# Altium project ATLAS(RZG2L).PrjPcb
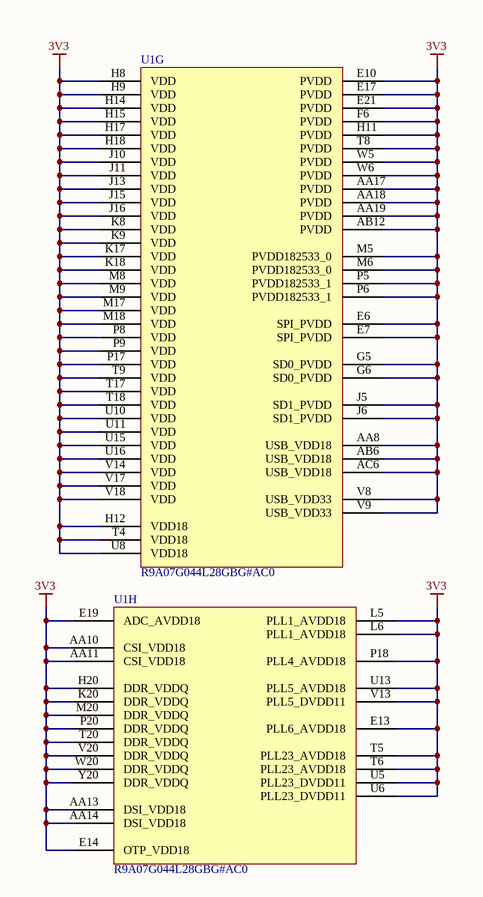
[diagram p0: MPU - PWR.SchDoc]
5 sheets, 21 parts. Net scope: global (net labels, ports and power ports of the same name join across sheets).
Board file: ATLAS(RZG2L).PcbDoc
Sheets:
  MPU - PWR.SchDoc
  MPU - GND.SchDoc
  MPU - DDR.SchDoc
  MPU - IO.SchDoc
  PMIC.SchDoc

## Sheet MPU - PWR.SchDoc
size A4; SheetNumber: 1; SheetTotal: 3

### Parts
U1  R9A07G044L28GBG#AC0  [R9A07G044L28GBG#AC0]  (parts G,H of 11)

### Nets
3V3: U1.AA8(USB_VDD18) U1.AA10(CSI_VDD18) U1.AA11(CSI_VDD18) U1.AA13(DSI_VDD18) U1.AA14(DSI_VDD18) U1.AA17(PVDD) U1.AA18(PVDD) U1.AA19(PVDD) U1.AB6(USB_VDD18) U1.AB12(PVDD) U1.AC6(USB_VDD18) U1.E6(SPI_PVDD) U1.E7(SPI_PVDD) U1.E10(PVDD) U1.E13(PLL6_AVDD18) U1.E14(OTP_VDD18) U1.E17(PVDD) U1.E19(ADC_AVDD18) U1.E21(PVDD) U1.F6(PVDD) U1.G5(SD0_PVDD) U1.G6(SD0_PVDD) U1.H8(VDD) U1.H9(VDD) U1.H11(PVDD) U1.H12(VDD18) U1.H14(VDD) U1.H15(VDD) U1.H17(VDD) U1.H18(VDD) U1.H20(DDR_VDDQ) U1.J5(SD1_PVDD) U1.J6(SD1_PVDD) U1.J10(VDD) U1.J11(VDD) U1.J13(VDD) U1.J15(VDD) U1.J16(VDD) U1.K8(VDD) U1.K9(VDD) U1.K17(VDD) U1.K18(VDD) U1.K20(DDR_VDDQ) U1.L5(PLL1_AVDD18) U1.L6(PLL1_AVDD18) U1.M5(PVDD182533_0) U1.M6(PVDD182533_0) U1.M8(VDD) U1.M9(VDD) U1.M17(VDD) U1.M18(VDD) U1.M20(DDR_VDDQ) U1.P5(PVDD182533_1) U1.P6(PVDD182533_1) U1.P8(VDD) U1.P9(VDD) U1.P17(VDD) U1.P18(PLL4_AVDD18) U1.P20(DDR_VDDQ) U1.T4(VDD18) U1.T5(PLL23_AVDD18) U1.T6(PLL23_AVDD18) U1.T8(PVDD) U1.T9(VDD) U1.T17(VDD) U1.T18(VDD) U1.T20(DDR_VDDQ) U1.U5(PLL23_DVDD11) U1.U6(PLL23_DVDD11) U1.U8(VDD18) U1.U10(VDD) U1.U11(VDD) U1.U13(PLL5_AVDD18) U1.U15(VDD) U1.U16(VDD) U1.V8(USB_VDD33) U1.V9(USB_VDD33) U1.V13(PLL5_DVDD11) U1.V14(VDD) U1.V17(VDD) U1.V18(VDD) U1.V20(DDR_VDDQ) U1.W5(PVDD) U1.W6(PVDD) U1.W20(DDR_VDDQ) U1.Y20(DDR_VDDQ)

### Library data of the parts
U1 = R9A07G044L28GBG#AC0: MPU RZ/G2L ARM Cortex-A55+/ARM Cortex-M33 RISC 64-Bit 1.2GHz 1.8V/3.3V 551-Pin BGA; Manufacturer Lifecycle Status: ACTIVE; Pitch: 800µm; Max Supply Voltage: 3.63V; Min Supply Voltage: 2.97V; RAM Size: 128kB; Number of USB Channels: 2; ComponentLink2Description: Datasheet URL; Mount: Surface Mount; ComponentLink2URL: https://octopart.com/cad-content/api/get-model-datasheet/15189/122020395; Height: 1.4mm; Export Control Classification Number (ECCN) Code: 3A991; Frequency: 1.2GHz; Max Frequency: 1.2GHz; ComponentLink1URL: http://www.renesas.com; Case/Package: BGA; Length: 21mm; Lifecycle Status: Production; ComponentLink3Description: Manufacturer's Package Drawing; Width: 21mm; China RoHS: Compliant; ComponentLink1Description: Manufacturer's Website; HelpURL: https://octopart.com/cad-content/api/get-model-datasheet/15189/122020395; RoHS: Compliant; Number of Pins: 551; ComponentLink3URL: https://www.renesas.com/en/document/psc/package-drawing-lfbga-551pin-plbg0551ga

## Sheet MPU - GND.SchDoc
size A4; SheetNumber: 2; SheetTotal: 4
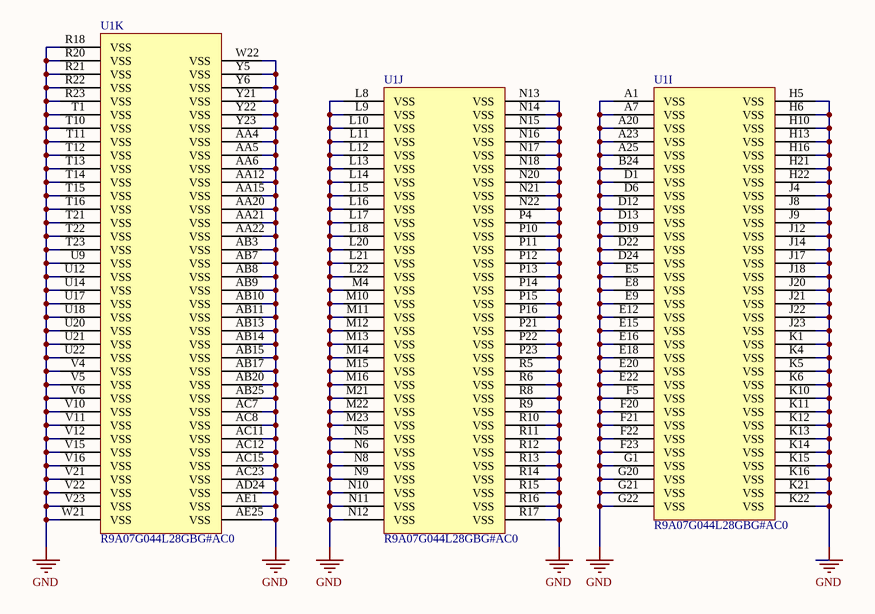
[diagram p1: MPU - GND.SchDoc]

### Parts
U1  R9A07G044L28GBG#AC0  [R9A07G044L28GBG#AC0]  (parts I,J,K of 11)

### Nets
GND: U1.A1(VSS) U1.A7(VSS) U1.A20(VSS) U1.A23(VSS) U1.A25(VSS) U1.AA4(VSS) U1.AA5(VSS) U1.AA6(VSS) U1.AA12(VSS) U1.AA15(VSS) U1.AA20(VSS) U1.AA21(VSS) U1.AA22(VSS) U1.AB3(VSS) U1.AB7(VSS) U1.AB8(VSS) U1.AB9(VSS) U1.AB10(VSS) U1.AB11(VSS) U1.AB13(VSS) U1.AB14(VSS) U1.AB15(VSS) U1.AB17(VSS) U1.AB20(VSS) U1.AB25(VSS) U1.AC7(VSS) U1.AC8(VSS) U1.AC11(VSS) U1.AC12(VSS) U1.AC15(VSS) U1.AC23(VSS) U1.AD24(VSS) U1.AE1(VSS) U1.AE25(VSS) U1.B24(VSS) U1.D1(VSS) U1.D6(VSS) U1.D12(VSS) U1.D13(VSS) U1.D19(VSS) U1.D22(VSS) U1.D24(VSS) U1.E5(VSS) U1.E8(VSS) U1.E9(VSS) U1.E12(VSS) U1.E15(VSS) U1.E16(VSS) U1.E18(VSS) U1.E20(VSS) U1.E22(VSS) U1.F5(VSS) U1.F20(VSS) U1.F21(VSS) U1.F22(VSS) U1.F23(VSS) U1.G1(VSS) U1.G20(VSS) U1.G21(VSS) U1.G22(VSS) U1.H5(VSS) U1.H6(VSS) U1.H10(VSS) U1.H13(VSS) U1.H16(VSS) U1.H21(VSS) U1.H22(VSS) U1.J4(VSS) U1.J8(VSS) U1.J9(VSS) U1.J12(VSS) U1.J14(VSS) U1.J17(VSS) U1.J18(VSS) U1.J20(VSS) U1.J21(VSS) U1.J22(VSS) U1.J23(VSS) U1.K1(VSS) U1.K4(VSS) U1.K5(VSS) U1.K6(VSS) U1.K10(VSS) U1.K11(VSS) U1.K12(VSS) U1.K13(VSS) U1.K14(VSS) U1.K15(VSS) U1.K16(VSS) U1.K21(VSS) U1.K22(VSS) U1.L8(VSS) U1.L9(VSS) U1.L10(VSS) U1.L11(VSS) U1.L12(VSS) U1.L13(VSS) U1.L14(VSS) U1.L15(VSS) U1.L16(VSS) U1.L17(VSS) U1.L18(VSS) U1.L20(VSS) U1.L21(VSS) U1.L22(VSS) U1.M4(VSS) U1.M10(VSS) U1.M11(VSS) U1.M12(VSS) U1.M13(VSS) U1.M14(VSS) U1.M15(VSS) U1.M16(VSS) U1.M21(VSS) U1.M22(VSS) U1.M23(VSS) U1.N5(VSS) U1.N6(VSS) U1.N8(VSS) U1.N9(VSS) U1.N10(VSS) U1.N11(VSS) U1.N12(VSS) U1.N13(VSS) U1.N14(VSS) U1.N15(VSS) U1.N16(VSS) U1.N17(VSS) U1.N18(VSS) U1.N20(VSS) U1.N21(VSS) U1.N22(VSS) U1.P4(VSS) U1.P10(VSS) U1.P11(VSS) U1.P12(VSS) U1.P13(VSS) U1.P14(VSS) U1.P15(VSS) U1.P16(VSS) U1.P21(VSS) U1.P22(VSS) U1.P23(VSS) U1.R5(VSS) U1.R6(VSS) U1.R8(VSS) U1.R9(VSS) U1.R10(VSS) U1.R11(VSS) U1.R12(VSS) U1.R13(VSS) U1.R14(VSS) U1.R15(VSS) U1.R16(VSS) U1.R17(VSS) U1.R18(VSS) U1.R20(VSS) U1.R21(VSS) U1.R22(VSS) U1.R23(VSS) U1.T1(VSS) U1.T10(VSS) U1.T11(VSS) U1.T12(VSS) U1.T13(VSS) U1.T14(VSS) U1.T15(VSS) U1.T16(VSS) U1.T21(VSS) U1.T22(VSS) U1.T23(VSS) U1.U9(VSS) U1.U12(VSS) U1.U14(VSS) U1.U17(VSS) U1.U18(VSS) U1.U20(VSS) U1.U21(VSS) U1.U22(VSS) U1.V4(VSS) U1.V5(VSS) U1.V6(VSS) U1.V10(VSS) U1.V11(VSS) U1.V12(VSS) U1.V15(VSS) U1.V16(VSS) U1.V21(VSS) U1.V22(VSS) U1.V23(VSS) U1.W21(VSS) U1.W22(VSS) U1.Y5(VSS) U1.Y6(VSS) U1.Y21(VSS) U1.Y22(VSS) U1.Y23(VSS)

### Library data of the parts
U1 = R9A07G044L28GBG#AC0: as U1 on sheet MPU - PWR; ComponentLink2Description: Datasheet URL; Mount: Surface Mount; ComponentLink2URL: https://octopart.com/cad-content/api/get-model-datasheet/15189/122020395; Height: 1.4mm; Export Control Classification Number (ECCN) Code: 3A991; Frequency: 1.2GHz; Max Frequency: 1.2GHz; ComponentLink1URL: http://www.renesas.com; Case/Package: BGA; Length: 21mm; Lifecycle Status: Production; ComponentLink3Description: Manufacturer's Package Drawing; Width: 21mm; China RoHS: Compliant; ComponentLink1Description: Manufacturer's Website; HelpURL: https://octopart.com/cad-content/api/get-model-datasheet/15189/122020395; RoHS: Compliant; Number of Pins: 551; ComponentLink3URL: https://www.renesas.com/en/document/psc/package-drawing-lfbga-551pin-plbg0551ga

## Sheet MPU - DDR.SchDoc
size A4; SheetNumber: 2; SheetTotal: 3
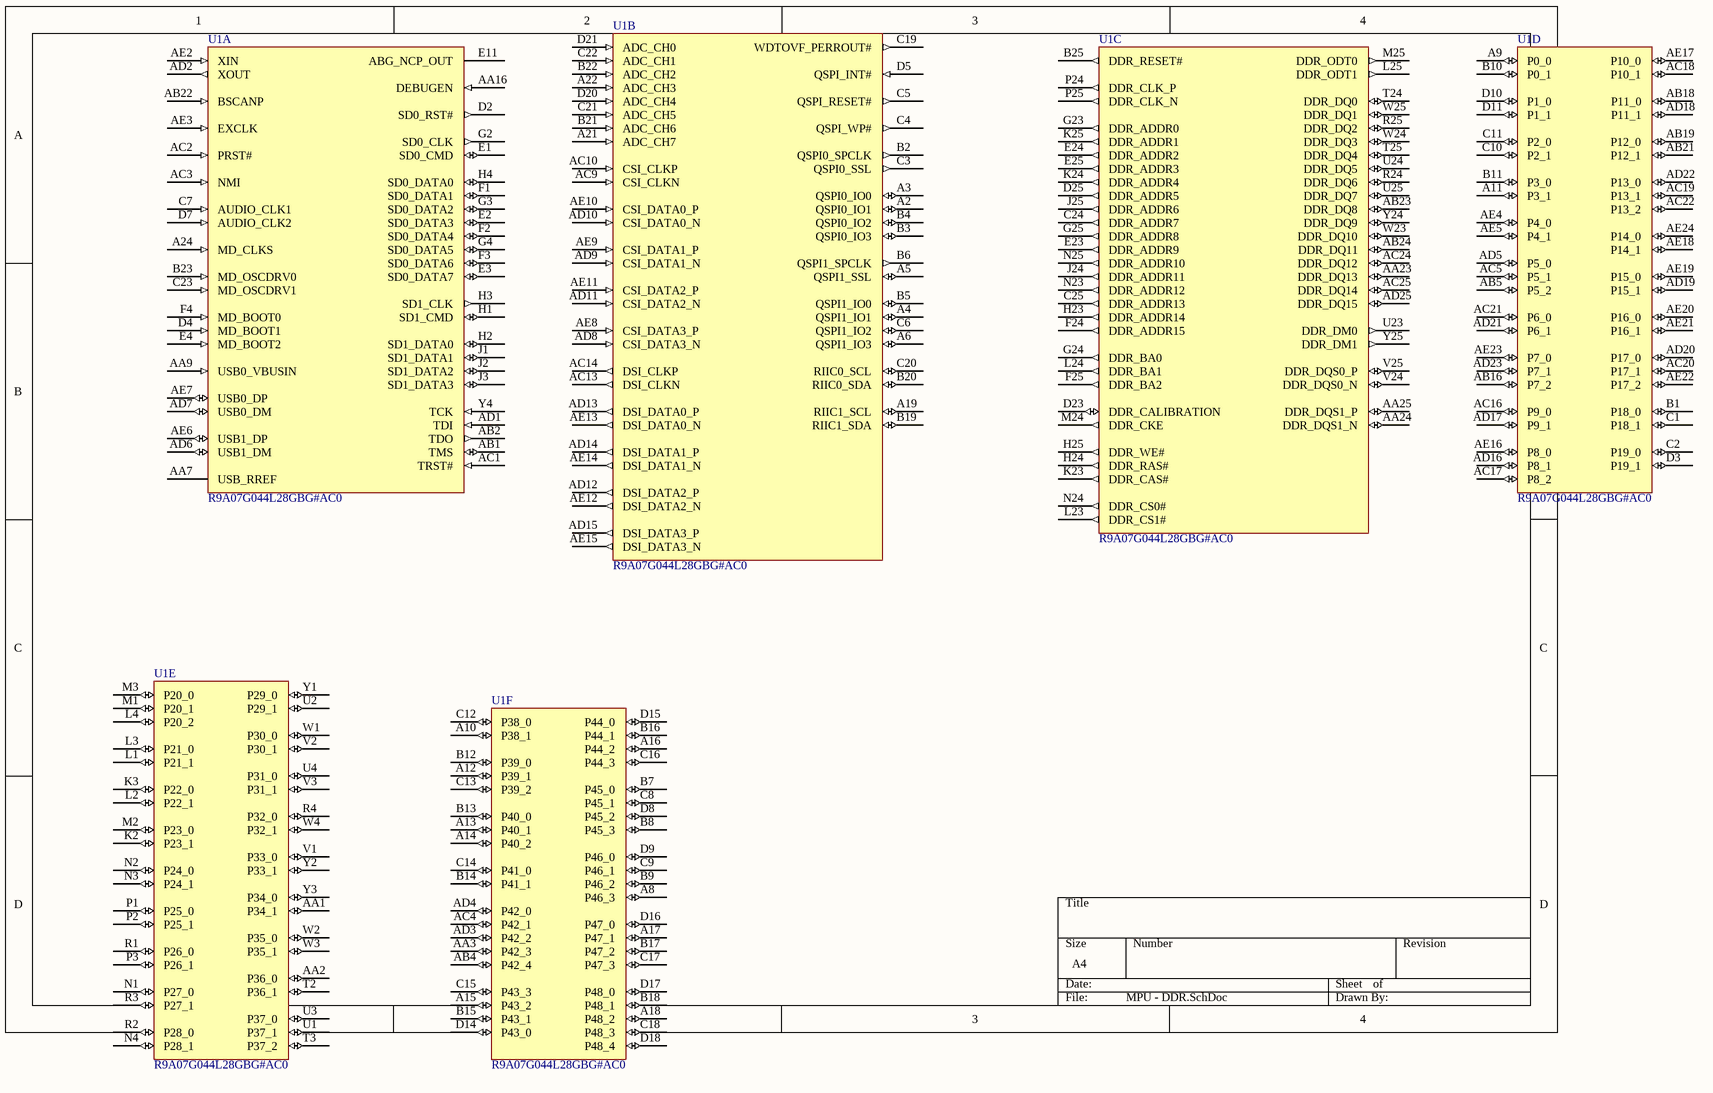
[diagram p2: MPU - DDR.SchDoc]

### Parts
U1  R9A07G044L28GBG#AC0  [R9A07G044L28GBG#AC0]  (parts A,B,C,D,E,F of 11)

### Nets

Not connected (* = marked no-connect by the designer): U1 A2(QSPI0_IO1) A3(QSPI0_IO0) A4(QSPI1_IO1) A5(QSPI1_SSL) A6(QSPI1_IO3) A8(P46_3) A9(P0_0) A10(P38_1) A11(P3_1) A12(P39_1) A13(P40_1) A14(P40_2) A15(P43_2) A16(P44_2) A17(P47_1) A18(P48_2) A19(RIIC1_SCL) A21(ADC_CH7) A22(ADC_CH3) A24(MD_CLKS) AA1(P34_1) AA2(P36_0) AA3(P42_3) AA7(USB_RREF) AA9(USB0_VBUSIN) AA16(DEBUGEN) AA23(DDR_DQ13) AA24(DDR_DQS1_N) AA25(DDR_DQS1_P) AB1(TMS) AB2(TDO) AB4(P42_4) AB5(P5_2) AB16(P7_2) AB18(P11_0) AB19(P12_0) AB21(P12_1) AB22(BSCANP) AB23(DDR_DQ8) AB24(DDR_DQ11) AC1(TRST#) AC2(PRST#) AC3(NMI) AC4(P42_1) AC5(P5_1) AC9(CSI_CLKN) AC10(CSI_CLKP) AC13(DSI_CLKN) AC14(DSI_CLKP) AC16(P9_0) AC17(P8_2) AC18(P10_1) AC19(P13_1) AC20(P17_1) AC21(P6_0) AC22(P13_2) AC24(DDR_DQ12) AC25(DDR_DQ14) AD1(TDI) AD2(XOUT) AD3(P42_2) AD4(P42_0) AD5(P5_0) AD6(USB1_DM) AD7(USB0_DM) AD8(CSI_DATA3_N) AD9(CSI_DATA1_N) AD10(CSI_DATA0_N) AD11(CSI_DATA2_N) AD12(DSI_DATA2_P) AD13(DSI_DATA0_P) AD14(DSI_DATA1_P) AD15(DSI_DATA3_P) AD16(P8_1) AD17(P9_1) AD18(P11_1) AD19(P15_1) AD20(P17_0) AD21(P6_1) AD22(P13_0) AD23(P7_1) AD25(DDR_DQ15) AE2(XIN) AE3(EXCLK) AE4(P4_0) AE5(P4_1) AE6(USB1_DP) AE7(USB0_DP) AE8(CSI_DATA3_P) AE9(CSI_DATA1_P) AE10(CSI_DATA0_P) AE11(CSI_DATA2_P) AE12(DSI_DATA2_N) AE13(DSI_DATA0_N) AE14(DSI_DATA1_N) AE15(DSI_DATA3_N) AE16(P8_0) AE17(P10_0) AE18(P14_1) AE19(P15_0) AE20(P16_0) AE21(P16_1) AE22(P17_2) AE23(P7_0) AE24(P14_0) B1(P18_0) B2(QSPI0_SPCLK) B3(QSPI0_IO3) B4(QSPI0_IO2) B5(QSPI1_IO0) B6(QSPI1_SPCLK) B7(P45_0) B8(P45_3) B9(P46_2) B10(P0_1) B11(P3_0) B12(P39_0) B13(P40_0) B14(P41_1) B15(P43_1) B16(P44_1) B17(P47_2) B18(P48_1) B19(RIIC1_SDA) B20(RIIC0_SDA) B21(ADC_CH6) B22(ADC_CH2) B23(MD_OSCDRV0) B25(DDR_RESET#) C1(P18_1) C2(P19_0) C3(QSPI0_SSL) C4(QSPI_WP#) C5(QSPI_RESET#) C6(QSPI1_IO2) C7(AUDIO_CLK1) C8(P45_1) C9(P46_1) C10(P2_1) C11(P2_0) C12(P38_0) C13(P39_2) C14(P41_0) C15(P43_3) C16(P44_3) C17(P47_3) C18(P48_3) C19(WDTOVF_PERROUT#) C20(RIIC0_SCL) C21(ADC_CH5) C22(ADC_CH1) C23(MD_OSCDRV1) C24(DDR_ADDR7) C25(DDR_ADDR13) D2(SD0_RST#) D3(P19_1) D4(MD_BOOT1) D5(QSPI_INT#) D7(AUDIO_CLK2) D8(P45_2) D9(P46_0) D10(P1_0) D11(P1_1) D14(P43_0) D15(P44_0) D16(P47_0) D17(P48_0) D18(P48_4) D20(ADC_CH4) D21(ADC_CH0) D23(DDR_CALIBRATION) D25(DDR_ADDR5) E1(SD0_CMD) E2(SD0_DATA3) E3(SD0_DATA7) E4(MD_BOOT2) E11(ABG_NCP_OUT) E23(DDR_ADDR9) E24(DDR_ADDR2) E25(DDR_ADDR3) F1(SD0_DATA1) F2(SD0_DATA4) F3(SD0_DATA6) F4(MD_BOOT0) F24(DDR_ADDR15) F25(DDR_BA2) G2(SD0_CLK) G3(SD0_DATA2) G4(SD0_DATA5) G23(DDR_ADDR0) G24(DDR_BA0) G25(DDR_ADDR8) H1(SD1_CMD) H2(SD1_DATA0) H3(SD1_CLK) H4(SD0_DATA0) H23(DDR_ADDR14) H24(DDR_RAS#) H25(DDR_WE#) J1(SD1_DATA1) J2(SD1_DATA2) J3(SD1_DATA3) J24(DDR_ADDR11) J25(DDR_ADDR6) K2(P23_1) K3(P22_0) K23(DDR_CAS#) K24(DDR_ADDR4) K25(DDR_ADDR1) L1(P21_1) L2(P22_1) L3(P21_0) L4(P20_2) L23(DDR_CS1#) L24(DDR_BA1) L25(DDR_ODT1) M1(P20_1) M2(P23_0) M3(P20_0) M24(DDR_CKE) M25(DDR_ODT0) N1(P27_0) N2(P24_0) N3(P24_1) N4(P28_1) N23(DDR_ADDR12) N24(DDR_CS0#) N25(DDR_ADDR10) P1(P25_0) P2(P25_1) P3(P26_1) P24(DDR_CLK_P) P25(DDR_CLK_N) R1(P26_0) R2(P28_0) R3(P27_1) R4(P32_0) R24(DDR_DQ6) R25(DDR_DQ2) T2(P36_1) T3(P37_2) T24(DDR_DQ0) T25(DDR_DQ4) U1(P37_1) U2(P29_1) U3(P37_0) U4(P31_0) U23(DDR_DM0) U24(DDR_DQ5) U25(DDR_DQ7) V1(P33_0) V2(P30_1) V3(P31_1) V24(DDR_DQS0_N) V25(DDR_DQS0_P) W1(P30_0) W2(P35_0) W3(P35_1) W4(P32_1) W23(DDR_DQ10) W24(DDR_DQ3) W25(DDR_DQ1) Y1(P29_0) Y2(P33_1) Y3(P34_0) Y4(TCK) Y24(DDR_DQ9) Y25(DDR_DM1)

### Library data of the parts
U1 = R9A07G044L28GBG#AC0: as U1 on sheet MPU - PWR; ComponentLink2Description: Datasheet URL; Mount: Surface Mount; ComponentLink2URL: https://octopart.com/cad-content/api/get-model-datasheet/15189/122020395; Height: 1.4mm; Export Control Classification Number (ECCN) Code: 3A991; Frequency: 1.2GHz; Max Frequency: 1.2GHz; ComponentLink1URL: http://www.renesas.com; Case/Package: BGA; Length: 21mm; Lifecycle Status: Production; ComponentLink3Description: Manufacturer's Package Drawing; Width: 21mm; China RoHS: Compliant; ComponentLink1Description: Manufacturer's Website; HelpURL: https://octopart.com/cad-content/api/get-model-datasheet/15189/122020395; RoHS: Compliant; Number of Pins: 551; ComponentLink3URL: https://www.renesas.com/en/document/psc/package-drawing-lfbga-551pin-plbg0551ga

## Sheet MPU - IO.SchDoc
size A4; SheetNumber: 3; SheetTotal: 3

## Sheet PMIC.SchDoc
size A4; SheetNumber: 6; SheetTotal: 6
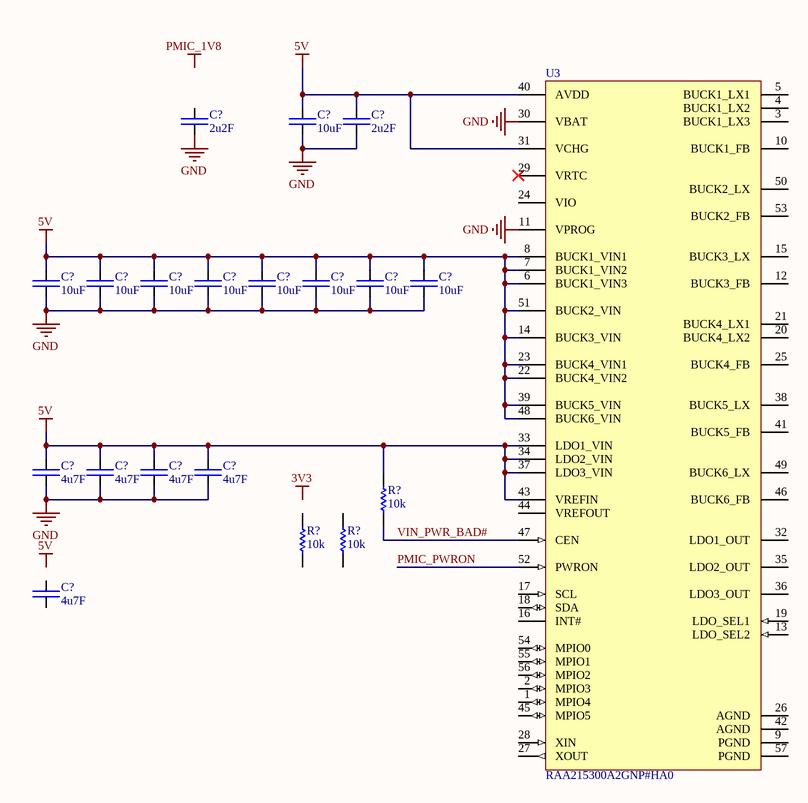
[diagram p3: PMIC.SchDoc]

### Parts
(Parts that share a designator on the sheet are numbered #1, #2 ... from top to bottom, then left to right.)
C?#1  2u2F  [CAP-0805]
C?#2  10uF  [CAP-1206]
C?#3  2u2F  [CAP-0805]
C?#4  10uF  [CAP-1206]
C?#5  10uF  [CAP-1206]
C?#6  10uF  [CAP-1206]
C?#7  10uF  [CAP-1206]
C?#8  10uF  [CAP-1206]
C?#9  10uF  [CAP-1206]
C?#10  10uF  [CAP-1206]
C?#11  10uF  [CAP-1206]
C?#12  4u7F  [CAP-0805]
C?#13  4u7F  [CAP-0805]
C?#14  4u7F  [CAP-0805]
C?#15  4u7F  [CAP-0805]
C?#16  4u7F  [CAP-0805]
R?#1  10k  [RES-0603]
R?#2  10k  [RES-0603]
R?#3  10k  [RES-0603]
U3  RAA215300A2GNP#HA0  [L56_8x8I_MFG]

### Nets
5V: C?#2.2 C?#3.2 C?#4.2 C?#5.2 C?#6.2 C?#7.2 C?#8.2 C?#9.2 C?#10.2 C?#11.2 C?#12.2 C?#13.2 C?#14.2 C?#15.2 R?#1.2 U3.6(BUCK1_VIN3) U3.7(BUCK1_VIN2) U3.8(BUCK1_VIN1) U3.14(BUCK3_VIN) U3.22(BUCK4_VIN2) U3.23(BUCK4_VIN1) U3.31(VCHG) U3.33(LDO1_VIN) U3.34(LDO2_VIN) U3.37(LDO3_VIN) U3.39(BUCK5_VIN) U3.40(AVDD) U3.43(VREFIN) U3.48(BUCK6_VIN) U3.51(BUCK2_VIN)
GND: C?#1.1 C?#2.1 C?#3.1 C?#4.1 C?#5.1 C?#6.1 C?#7.1 C?#8.1 C?#9.1 C?#10.1 C?#11.1 C?#12.1 C?#13.1 C?#14.1 C?#15.1 U3.11(VPROG) U3.30(VBAT)
PMIC_PWRON: U3.52(PWRON)
VIN_PWR_BAD#: R?#1.1 U3.47(CEN)

Not connected (* = marked no-connect by the designer): C?#1 2; C?#16 1 2; R?#2 1 2; R?#3 1 2; U3 1(MPIO4) 2(MPIO3) 3(BUCK1_LX3) 4(BUCK1_LX2) 5(BUCK1_LX1) 9(PGND) 10(BUCK1_FB) 12(BUCK3_FB) 13(LDO_SEL2) 15(BUCK3_LX) 16(INT#) 17(SCL) 18(SDA) 19(LDO_SEL1) 20(BUCK4_LX2) 21(BUCK4_LX1) 24(VIO) 25(BUCK4_FB) 26(AGND) 27(XOUT) 28(XIN) 29(VRTC)* 32(LDO1_OUT) 35(LDO2_OUT) 36(LDO3_OUT) 38(BUCK5_LX) 41(BUCK5_FB) 42(AGND) 44(VREFOUT) 45(MPIO5) 46(BUCK6_FB) 49(BUCK6_LX) 50(BUCK2_LX) 53(BUCK2_FB) 54(MPIO0) 55(MPIO1) 56(MPIO2) 57(PGND)

### Notes on the sheet
- Labels drawn without touching a wire or pin: 3V3, 5V, PMIC_1V8

### Library data of the parts
C?#1 C?#3 C?#12-C?#16 = CAP-0805: Capacitor chip unpolarized. 0805
C?#2 C?#4-C?#11 = CAP-1206: Capacitor chip unpolarized. 1206
R?#1-R?#3 = RES-0603: Resistor chip. 0603
U3 = CMP-00572-119775525-1: Power Management Specialized - PMIC RAA215300A2GNP#HA0 9-Channel PMIC with RTC 56L QFN; Manufacturer Lifecycle Status: ACTIVE; Max Supply Voltage: 5.5V; Min Supply Voltage: 2.7V; Max Supply Current: 4.8mA; Threshold Voltage: 2.1V; Number of Circuits: 1; Pitch: 500µm; Nominal Supply Voltage (DC): 5V; Number of Channels: 9; Harmonized Tariff Schedule (HTS) Code: 8540000000; Introduction Date: 2022-04-01; HelpURL: https://octopart.com/cad-content/api/get-model-datasheet/15189/119775525; ComponentLink2URL: https://octopart.com/cad-content/api/get-model-datasheet/15189/119775525; MSL: 3; Height - Seated (Max): 1mm; ComponentLink3Description: Manufacturer's Package Drawing; Height: 950µm; Part Family: RAA215300; Min Operating Temperature: -40°C; ComponentLink2Description: Datasheet URL; ComponentLink1Description: Manufacturer's Website; Width: 8mm; Lifecycle Status: Production; Package Quantity: 0; Export Control Classification Number (ECCN) Code: EAR99; REACH SVHC: Yes; Number of Terminals: 56; RoHS: Compliant; Max Operating Temperature: 105°C; Number of Pins: 56; Case/Package: QFN; Length: 8mm; Terminal Pitch: 500µm; ComponentLink3URL: https://www.renesas.com/en/document/psc/l568x8i-56-lead-quad-flat-no-lead-plastic-package-5x5mm-exposed-paddle; ComponentLink1URL: http://www.renesas.com

## Nets that join several sheets
GND: MPU - GND (197 pins), PMIC (17 pins)